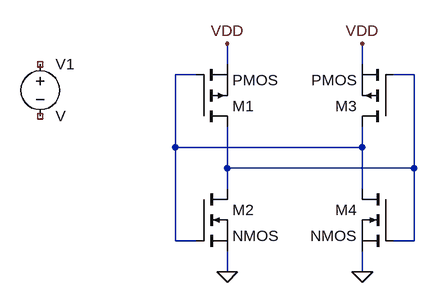
[diagram p0: schematic cmos_bistable_cell.asc]
cmos_bistable_cell.asc, the LTspice schematic file:
Version 4.1
SHEET 1 880 680
WIRE 160 64 160 32
WIRE 368 64 368 32
WIRE 112 80 80 80
WIRE 448 80 416 80
WIRE 80 192 80 80
WIRE 368 192 368 160
WIRE 368 192 80 192
WIRE 160 224 160 160
WIRE 448 224 448 80
WIRE 448 224 160 224
WIRE 160 256 160 224
WIRE 368 256 368 192
WIRE 80 336 80 192
WIRE 112 336 80 336
WIRE 448 336 448 224
WIRE 448 336 416 336
WIRE 160 384 160 352
WIRE 368 384 368 352
FLAG 160 384 0
FLAG 160 32 VDD
FLAG 368 384 0
FLAG 368 32 VDD
SYMBOL pmos 112 160 M180
SYMATTR InstName M1
SYMBOL nmos 112 256 R0
SYMATTR InstName M2
SYMBOL pmos 416 160 R180
SYMATTR InstName M3
SYMBOL nmos 416 256 M0
SYMATTR InstName M4
SYMBOL voltage -128 48 R0
SYMATTR InstName V1

The netlist it stands for:
* cmos_bistable_cell.asc
M1 N002 N001 VDD VDD PMOS
M2 N002 N001 0 0 NMOS
M3 N001 N002 VDD VDD PMOS
M4 N001 N002 0 0 NMOS
V1 NC_01 NC_02 V
.model NMOS NMOS
.model PMOS PMOS
.lib standard.mos
.backanno
.end